# EasyEDA Pro project 2023新生开发板（小组）.eprj, board PCB5
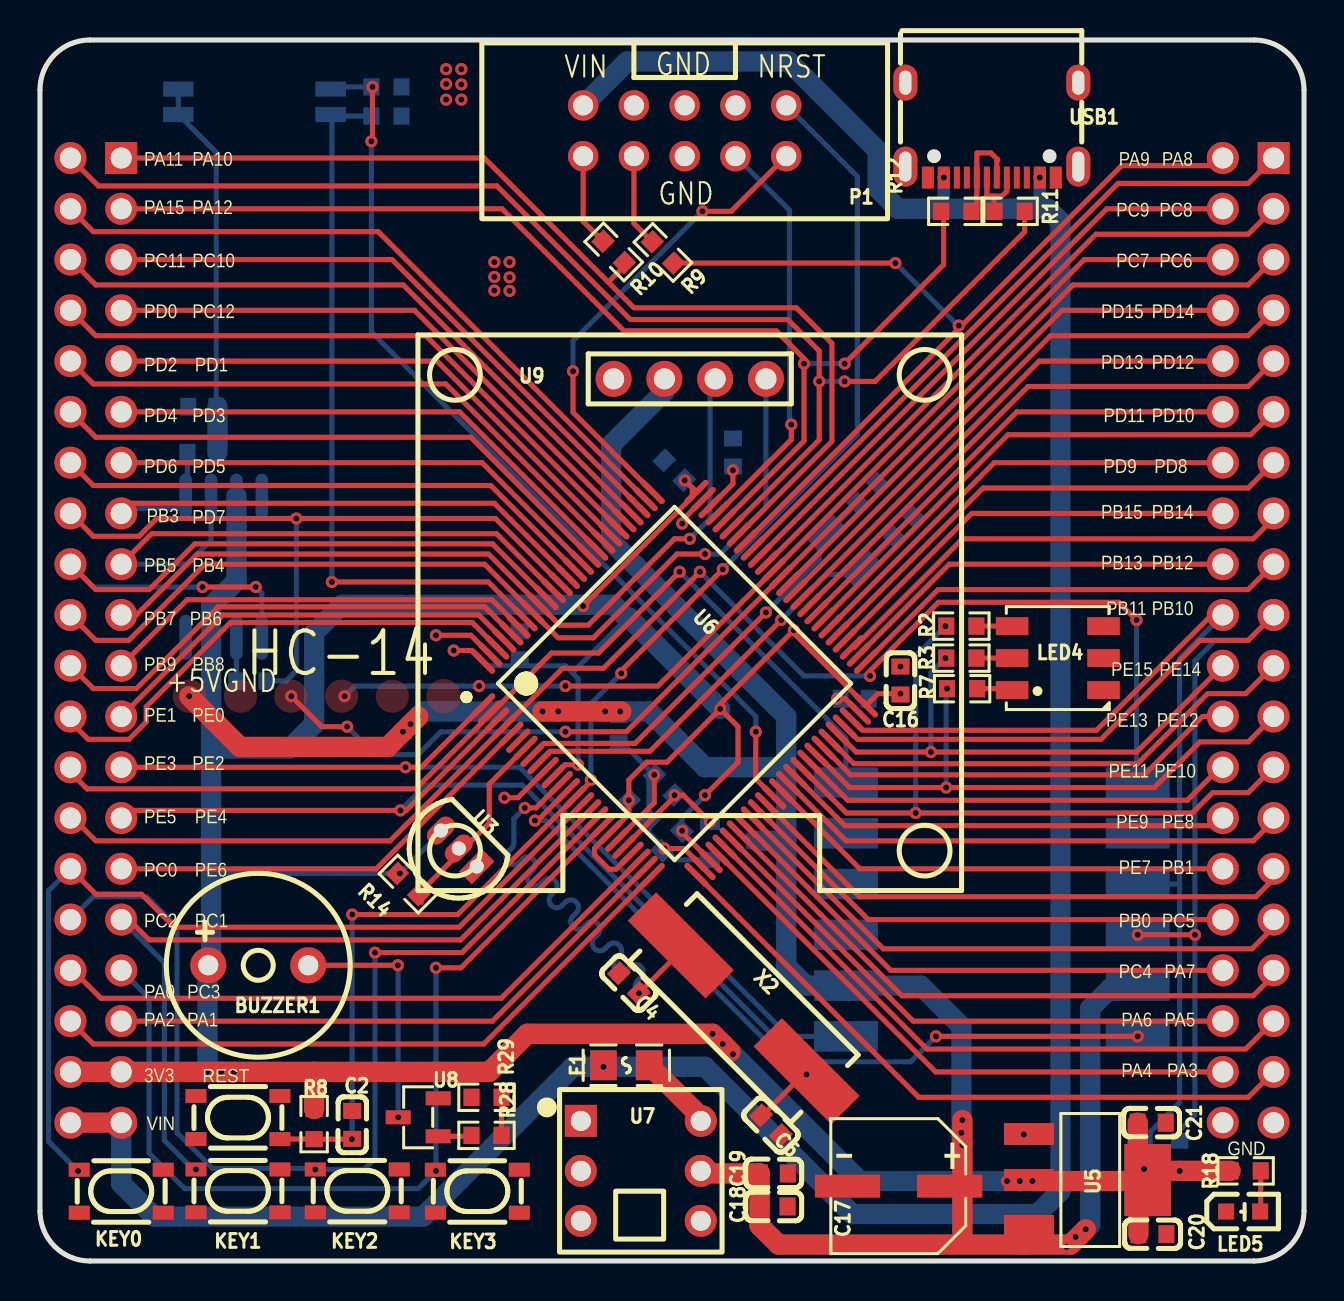
[diagram p6: board, top side]
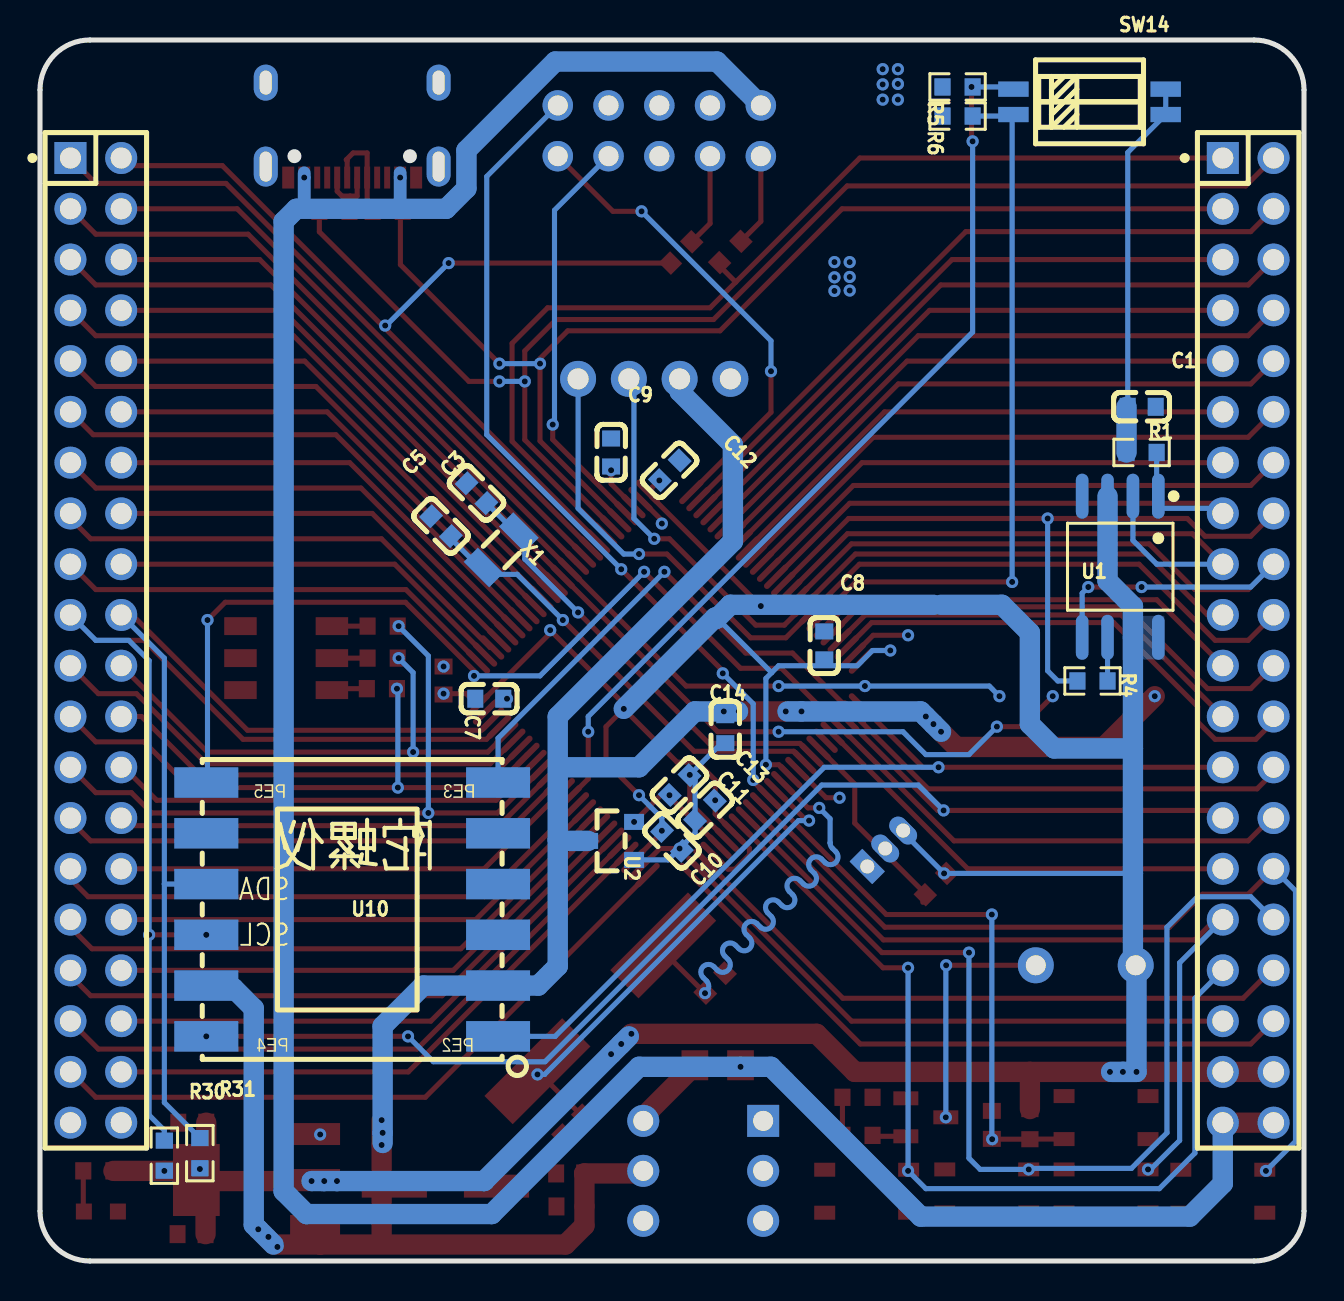
[diagram p7: board, bottom side, seen from below]

Outline 63.25 x 61.09 mm; copper layers: Top Layer, Bottom Layer. Coordinates in mm from the lower left corner of the outline.
Outline path: 0,58.59 0,2.5 arc(0.73,0.73) 2.5,0 60.75,0 arc(62.51,0.73) 63.25,2.5 63.25,58.59 arc(62.51,60.35) 60.75,61.09 2.5,61.09 arc(0.73,60.35) 0,58.59
Stack: Top Layer 0.035mm / Dielectric1 1.51mm FR4 er 4.5 / Bottom Layer 0.035mm

## Design rules (mm)
template: 自定义配置
spacing copperThickness1oz (default): track to track 0.102, other pairs 0.152 to 0.3
spacing copperThickness2oz: track to track 0.203, other pairs 0.152 to 0.3
track width copperThickness1oz (default): min 0.127, default 0.254, max 2.54
track width copperThickness2oz: min 0.203, default 0.254, max 2.54
differential pair differentialPair (default): width min 0.127, default 0.254, max 2.54; gap min 0.152, default 0.152
via viaSize (default): diameter min 0.5, default 0.61, max 10; hole min 0.3, default 0.305, max 6.3
net 3V3 uses copperRegion1
net VIN uses copperRegion1

## Placement (name value [footprint] x y rotation side)
BUZZER1  3kHz  [BUZ-TH_BD9.0-P5.00-D0.6-FD]  10.92 14.8 0 top
C1  100nF  [C0603]  8.12 42.74 180 bottom
C2  100nF  [C0603]  15.62 6.81 270 top
C3  12pF  [C0603]  41.4 38.42 225 bottom
C4  20pF  [C0603]  29.46 13.91 135 top
C5  12pF  [C0603]  43.18 36.77 225 bottom
C6  20pF  [C0603]  36.58 6.79 315 top
C7  1uF  [C0603]  40.77 28.13 180 bottom
C8  100nF  [C0603]  24 30.8 90 bottom
C9  1uF  [C0603]  34.67 40.45 270 bottom
C10  100nF  [C0603]  31.62 21.02 225 bottom
C11  100nF  [C0603]  29.97 22.54 315 bottom
C12  100nF  [C0603]  31.74 39.56 135 bottom
C13  100nF  [C0603]  31.24 23.81 135 bottom
C14  1uF  [C0603]  28.96 26.61 90 bottom
C16  100nF  [C0603]  43.05 29.04 90 top
C17  220uF  [CAP-SMD_BD6.3-L6.6-W6.6-LS7.2-R-RD]  42.96 3.75 0 top
C18  1uF  [C0603]  36.7 2.73 180 top
C19  100nF  [C0603]  36.72 4.38 0 top
C20  1uF  [C0603]  55.66 1.34 180 top
C21  100nF  [C0603]  55.63 6.92 0 top
F1  BSMD0805-020-30V  [F0805]  29.34 9.79 180 top
H1  X6521WV-2x20H-C60D30  [HDR-TH_40P-2.54-V-M-R2-C20-S2.54]  60.45 31.05 270 bottom
H2  X6521WV-2x20H-C60D30  [HDR-TH_40P-2.54-V-M-R2-C20-S2.54]  2.79 31.05 270 bottom
KEY0  SKRPACE010  [KEY-SMD_4P-L4.2-W3.2-P2.20-LS4.6]  4.06 3.49 0 top
KEY1  SKRPACE010  [KEY-SMD_4P-L4.2-W3.2-P2.20-LS4.6]  9.91 3.51 0 top
KEY2  SKRPACE010  [KEY-SMD_4P-L4.2-W3.2-P2.20-LS4.6]  15.88 3.51 0 top
KEY3  SKRPACE010  [KEY-SMD_4P-L4.2-W3.2-P2.20-LS4.6]  21.88 3.49 0 top
LED4  MHP5050RGBDT  [LED-ARRAY-SMD_6P-L5.0-W5.0-TR-RD]  50.93 30.16 180 top
LED5  NCD0603R3  [LED0603-R-RD_RED]  60.2 2.48 0 top
P1  2.54-2*5P简牛  [IDC-TH_10P-P2.54_C5665]  32.26 56.54 180 top
R1  10kΩ  [R0603]  8.13 40.45 180 bottom
R2  220Ω  [R0603]  46.1 31.76 0 top
R3  220Ω  [R0603]  46.1 30.16 0 top
R4  20Ω  [R0603]  10.58 29.02 0 bottom
R5  10kΩ  [R0603]  17.34 58.74 0 bottom
R6  10kΩ  [R0603]  17.34 57.28 0 bottom
R7  220Ω  [R0603]  46.14 28.63 0 top
R8  10kΩ  [R0603]  13.72 6.85 270 top
R9  20Ω  [R0603]  31.17 50.46 315 top
R10  20Ω  [R0603]  28.71 50.48 135 top
R11  20Ω  [R0603]  48.51 52.51 180 top
R12  20Ω  [R0603]  45.85 52.51 0 top
R14  10K  [R0603]  18.42 18.86 135 top
R18  470Ω  [R0603]  60.33 4.51 0 top
R28  4.7K  [R0603]  22.34 6.29 180 top
R29  10K  [R0603]  22.34 8.19 180 top
R30  4.7K  [R0603]  57.02 5.27 270 bottom
R31  4.7K  [R0603]  55.24 5.4 270 bottom
REST  SKRPACE010  [KEY-SMD_4P-L4.2-W3.2-P2.20-LS4.6]  9.91 7.18 180 top
SW14  DSHP02TSGET  [SW-SMD_4P_DSHP02TSGET]  10.73 57.99 270 bottom
U1  W25Q16JVSSIQ  [SOIC-8_L5.3-W5.3-P1.27-LS8.0-BL]  9.2 34.73 0 bottom
U2  PJ75AL33SA  [SOT-23_L2.9-W1.3-P1.90-LS2.4-BR]  34.67 21.02 180 bottom
U3  DS18B20  [TO-92-3_L4.9-W3.7-P1.27-L]  20.95 20.64 135 top
U5  AMS1117-3.3  [SOT-223-3_L6.5-W3.4-P2.30-LS7.0-BR]  52.45 4.05 180 top
U6  STM32F407VET6  [LQFP-100_L14.0-W14.0-P0.50-LS16.0-BL]  31.75 28.89 315 top
U7  PB-22E08  [SW-TH_6P-L8.0-W8.0-P2.50_PB-22E08]  30.06 4.51 270 top
U8  SS8050  [SOT-23-3_L2.9-W1.3-P1.90-LS2.4-BR]  18.92 7.19 0 top
U9  HS96L03W2C03  [OLED-TH_L27.8-W27.2-P2.54_C9900033791]  32.51 44.13 0 top
U10  jy901s  [COMM-SMD_JY901S-1]  47.63 17.59 0 bottom
USB1  TYPE-C 16PIN 2MD(073)  [USB-C-SMD_TYPE-C-6PIN-2MD-073]  47.63 56.58 180 top
X1  32.768kHz  [FC-135R_L3.2-W1.5]  40.17 35.58 135 bottom
X2  8MHz  [CRYSTAL-SMD_L11.5-W4.8-LS12.7]  35.21 12.64 315 top

## Footprints (pads in the part's own frame, mm; a bottom-side part is the same pattern mirrored in y, then rotated)
BUZ-TH_BD9.0-P5.00-D0.6-FD
  round 1.8 hole 1: 1(-2.5,0) 2(2.5,0)
C0603
  rect 0.8x0.9 smd: 1(-0.7,0) 2(0.7,0)
CAP-SMD_BD6.3-L6.6-W6.6-LS7.2-R-RD
  rect 3.26x1.15 smd: 1(2.555,0) 2(-2.555,0)
COMM-SMD_JY901S-1
  rect 3.2x1.524 smd: 1(-7.3,6.35) 2(-7.3,3.81) 3(-7.3,1.27) 4(-7.3,-1.27) 5(-7.3,-3.81) 6(-7.3,-6.35) 7(7.3,-6.35) 8(7.3,-3.81) 9(7.3,-1.27) 10(7.3,1.27) 11(7.3,3.81) 12(7.3,6.35)
CRYSTAL-SMD_L11.5-W4.8-LS12.7
  rect 5.5x2 smd: 1(-4.45,0) 2(4.45,0)
F0805
  rect 1.335x1.5 smd: 1(-1.143,0) 2(1.143,0)
FC-135R_L3.2-W1.5
  rect 1x1.8 smd: 1(-1.25,0) 2(1.25,0)
HDR-TH_40P-2.54-V-M-R2-C20-S2.54
  rect 1.6x1.6 hole 1.05: 1(-24.13,-1.27)
  round 1.6 hole 1.05: 2(-24.13,1.27) 3(-21.59,-1.27) 4(-21.59,1.27) 5(-19.05,-1.27) 6(-19.05,1.27) 7(-16.51,-1.27) 8(-16.51,1.27) 9(-13.97,-1.27) 10(-13.97,1.27) 11(-11.43,-1.27) 12(-11.43,1.27) 13(-8.89,-1.27) 14(-8.89,1.27) 15(-6.35,-1.27) 16(-6.35,1.27) 17(-3.81,-1.27) 18(-3.81,1.27) 19(-1.27,-1.27) 20(-1.27,1.27) 21(1.27,-1.27) 22(1.27,1.27) 23(3.81,-1.27) 24(3.81,1.27) 25(6.35,-1.27) 26(6.35,1.27) 27(8.89,-1.27) 28(8.89,1.27) 29(11.43,-1.27) 30(11.43,1.27) 31(13.97,-1.27) 32(13.97,1.27) 33(16.51,-1.27) 34(16.51,1.27) 35(19.05,-1.27) 36(19.05,1.27) 37(21.59,-1.27) 38(21.59,1.27) 39(24.13,-1.27) 40(24.13,1.27)
IDC-TH_10P-P2.54_C5665
  round 1.524 hole 1: 1(-5.08,-1.27) 2(-5.08,1.27) 3(-2.54,-1.27) 4(-2.54,1.27) 5(0,-1.27) 6(0,1.27) 7(2.54,-1.27) 8(2.54,1.27) 9(5.08,-1.27) 10(5.08,1.27)
KEY-SMD_4P-L4.2-W3.2-P2.20-LS4.6
  rect 1.05x0.7 smd: 1(-2.1,1.075) 2(2.1,1.075) 3(-2.1,-1.075) 4(2.1,-1.075)
LED0603-R-RD_RED
  rect 0.8x0.8 smd: 1(0.851,0) 2(-0.851,0)
LED-ARRAY-SMD_6P-L5.0-W5.0-TR-RD
  rect 1.625x0.896 smd: 1(2.288,1.6) 2(-2.288,1.6) 3(2.288,0) 4(-2.288,0) 5(2.288,-1.6) 6(-2.288,-1.6)
LQFP-100_L14.0-W14.0-P0.50-LS16.0-BL
  oval 0.3x1.6 smd: 1(-6,-7.55) 2(-5.5,-7.55) 3(-5,-7.55) 4(-4.5,-7.55) 5(-4,-7.55) 6(-3.5,-7.55) 7(-3,-7.55) 8(-2.5,-7.55) 9(-2,-7.55) 10(-1.5,-7.55) 11(-1,-7.55) 12(-0.5,-7.55) 13(0,-7.55) 14(0.5,-7.55) 15(1,-7.55) 16(1.5,-7.55) 17(2,-7.55) 18(2.5,-7.55) 19(3,-7.55) 20(3.5,-7.55) 21(4,-7.55) 22(4.5,-7.55) 23(5,-7.55) 24(5.5,-7.55) 25(6,-7.55) 51(6,7.55) 52(5.5,7.55) 53(5,7.55) 54(4.5,7.55) 55(4,7.55) 56(3.5,7.55) 57(3,7.55) 58(2.5,7.55) 59(2,7.55) 60(1.5,7.55) 61(1,7.55) 62(0.5,7.55) 63(0,7.55) 64(-0.5,7.55) 65(-1,7.55) 66(-1.5,7.55) 67(-2,7.55) 68(-2.5,7.55) 69(-3,7.55) 70(-3.5,7.55) 71(-4,7.55) 72(-4.5,7.55) 73(-5,7.55) 74(-5.5,7.55) 75(-6,7.55)
  oval 1.6x0.3 smd: 26(7.55,-6) 27(7.55,-5.5) 28(7.55,-5) 29(7.55,-4.5) 30(7.55,-4) 31(7.55,-3.5) 32(7.55,-3) 33(7.55,-2.5) 34(7.55,-2) 35(7.55,-1.5) 36(7.55,-1) 37(7.55,-0.5) 38(7.55,0) 39(7.55,0.5) 40(7.55,1) 41(7.55,1.5) 42(7.55,2) 43(7.55,2.5) 44(7.55,3) 45(7.55,3.5) 46(7.55,4) 47(7.55,4.5) 48(7.55,5) 49(7.55,5.5) 50(7.55,6) 76(-7.55,6) 77(-7.55,5.5) 78(-7.55,5) 79(-7.55,4.5) 80(-7.55,4) 81(-7.55,3.5) 82(-7.55,3) 83(-7.55,2.5) 84(-7.55,2) 85(-7.55,1.5) 86(-7.55,1) 87(-7.55,0.5) 88(-7.55,0) 89(-7.55,-0.5) 90(-7.55,-1) 91(-7.55,-1.5) 92(-7.55,-2) 93(-7.55,-2.5) 94(-7.55,-3) 95(-7.55,-3.5) 96(-7.55,-4) 97(-7.55,-4.5) 98(-7.55,-5) 99(-7.55,-5.5) 100(-7.55,-6)
OLED-TH_L27.8-W27.2-P2.54_C9900033791
  round 1.8 hole 1.05: 1(-3.81,0) 2(-1.27,0) 3(1.27,0) 4(3.81,0)
R0603
  rect 0.806x0.864 smd: 1(-0.753,0) 2(0.753,0)
SOIC-8_L5.3-W5.3-P1.27-LS8.0-BL
  oval 0.63x2.25 smd: 1(-1.905,-3.53) 2(-0.635,-3.53) 3(0.635,-3.53) 4(1.905,-3.53) 5(1.905,3.53) 6(0.635,3.53) 7(-0.635,3.53) 8(-1.905,3.53)
SOT-23-3_L2.9-W1.3-P1.90-LS2.4-BR
  rect 1.25x0.7 smd: 1(1,-0.95) 2(1,0.95) 3(-1,0)
SOT-23_L2.9-W1.3-P1.90-LS2.4-BR
  rect 1x0.8 smd: 1(1.15,-0.95) 2(1.15,0.95) 3(-1.15,0)
SOT-223-3_L6.5-W3.4-P2.30-LS7.0-BR
  rect 2.5x1.1 smd: 1(2.97,-2.3) 2(2.97,0) 3(2.97,2.3)
  rect 2.34x3.6 smd: 4(-2.97,0)
SW-SMD_4P_DSHP02TSGET
  rect 0.762x1.524 smd: 1(-0.635,-3.81) 2(0.635,-3.81) 3(0.635,3.81) 4(-0.635,3.81)
SW-TH_6P-L8.0-W8.0-P2.50_PB-22E08
  rect 1.6x1.6 hole 1: 1(-2.5,-3)
  round 1.6 hole 1: 2(0,-3) 3(2.5,-3) 4(-2.5,3) 5(0,3) 6(2.5,3)
TO-92-3_L4.9-W3.7-P1.27-L
  rect 0.9x1.6 hole 0.7: 1(-1.27,0)
  oval 0.9x1.6 hole 0.7: 2(0,0) 3(1.27,0)
USB-C-SMD_TYPE-C-6PIN-2MD-073
  rect 0.6x1.1 smd: 1(-3.2,2.375) 2(-2.4,2.375) 11(2.4,2.375) 12(3.2,2.375)
  rect 0.3x1.1 smd: 3(-1.75,2.375) 4(-1.25,2.375) 5(-0.75,2.375) 6(-0.25,2.375) 7(0.25,2.375) 8(0.75,2.375) 9(1.25,2.375) 10(1.75,2.375)
  oval 1.2x2 hole 0.6x1.5: 13(-4.325,1.825) 14(4.325,1.825)
  oval 1.2x1.8 hole 0.6x1.2: 13(-4.325,-2.375) 14(4.325,-2.375)

## Nets
As in the schematic, except:
GND: C1.2 C2.1 C3.1 C4.2 C5.1 C6.2 C7.1 C8.2 C9.1 C10.2 C11.2 C12.2 C13.2 C14.1 C16.2 C17.2 C18.1 C19.2 C20.1 C21.2 H1.39 H1.40 KEY0.4 KEY1.4 KEY2.4 KEY3.4 LED4.2 LED4.4 LED4.6 LED5.2 P1.5 P1.6 R5.2 R6.2 R29.2 REST.4 U1.4 U2.1 U3.1 U5.1 U6.10 U6.20 U6.27 U6.74 U6.99 U8.2 U9.1 U10.5 U10.8 USB1.1 USB1.12 USB1.13 USB1.14
KEY0: H2.30 KEY0.1 U6.15
KEY1: H2.31 KEY1.1 U6.16
KEY2: H2.32 KEY2.1 U6.17
KEY3: H2.33 KEY3.1 U6.18
NRST: C2.2 P1.1 R8.2 REST.1 U6.14

Pads without a net: KEY0 2 3; KEY1 2 3; KEY2 2 3; KEY3 2 3; P1 3 7; REST 2 3; U7 1 2 3 6; U10 3 4; USB1 3 4 9 10

## Via types
v1: diameter 0.61, hole 0.305, Top Layer to Bottom Layer, 121 vias

## Routing (per net, layer and track width the routed paths; a pad name or vN(x,y) marks a point on that pad's centre or on a via; arc(x,y) is an arc through that point)
3V3: length 228.2
  Top Layer w0.254: U6.11 26.27,24.83 v1(26.92,24.83) ; 32.64,38.68 32.27,39.05 v1(32.26,39.05) ; 32.64,38.68 U6.75 ; 32.64,38.68 32.64,38.23 v1(27.18,32.77) ; 33.55,20.02 32.13,21.44 v1(32.13,21.53) ; 22.17,29.99 21.61,30.54 v1(20.7,30.54) ; U6.22 28.83,19.6 28.47,19.6 27.75,20.32 27.75,20.65 29.46,22.36 v1(29.46,23.05) 29.46,24.07 30.35,24.96 31.37,24.96 v1(34.04,27.62) ; v1(33.27,23.3) 34.92,24.96 34.92,26.73 v1(34.04,27.62) ; v1(34.04,27.62) 34.04,27.88 v1(37.72,31.56) 37.72,31.41 U6.50 41.92,28.38 v1(43.05,28.38)
  Top Layer w1.016: 13.72,9.46 22.48,9.46 24.38,11.37 v1(33.65,11.37) v1(34.16,10.86) 34.54,10.48 ; 13.72,9.46 v1(9.71,9.46) v1(9.06,9.46) v1(8.38,9.46) H2.37 H2.38 ; 13.72,9.46 13.72,7.6 ; v1(49.02,4) 49.15,4 ; C20.2 54.96,3.83 55.64,4.51 v1(57.02,4.51) 59.57,4.51 ; C21.1 54.93,4.03 ; v1(49.66,4) 54.86,4
  Bottom Layer w0.254: v1(33.27,23.3) 32.13,22.16 v1(32.13,21.53) ; v1(20.7,30.54) 21.59,30.54 22.35,29.78 26.29,29.78 26.64,29.43 ; C1.1 8.82,55.46 SW14.3 SW14.4 ; U3.3 20.06,21.44 v1(18.01,19.39) 8.44,19.39 8.42,19.41 ; 26.64,29.43 29.33,32.13 29.4,32.13 ; 26.64,29.43 26.92,29.15 v1(26.92,24.83)
  Bottom Layer w1.016: 33.78,11.24 v1(34.16,10.86) v1(34.67,10.35) 41.02,4 v1(48.39,4) v1(49.02,4) v1(49.66,4) ; 8.56,25.64 8.56,14.93 BUZZER1.1 8.38,14.76 v1(8.38,9.46) v1(9.06,9.46) 9.65,9.46 ; 8.56,25.64 12.5,25.64 13.72,26.86 13.72,31.43 15.11,32.83 18.16,32.83 ; 8.56,25.64 U1.7 8.56,32.75 9.83,34.02 U1.3 ; v1(34.04,27.62) 29.47,32.19 29.4,32.13 28.7,32.83 18.54,32.83 ; 8.88,42.73 R1.1
  vias: v1(55.24,4.6)
+5V: length 130.1
  Top Layer w1.016: v1(7.47,28.26) 10.01,25.72 17.4,25.72 v1(18.16,26.48) v1(18.54,26.86) v1(18.92,27.24) ; v1(52.32,1.59) 51.56,0.83 49.22,0.83 ; 29.08,27.5 v1(28.28,27.5) v1(25.93,27.5) v1(25.14,27.5) ; 49.22,0.83 49.23,0.83 49.23,1.73 ; 49.22,0.83 36.95,0.83 36,1.77 C18.2 36,4.37 C19.1 33.19,4.38 U7.5 ; v1(46.15,7.05) v1(46.15,5.81) 46.15,1.34
  Bottom Layer w1.016: 28.32,27.5 v1(29.03,27.5) 30.48,27.5 33.27,24.7 37.08,24.7 ; 37.34,21.07 37.34,27.24 28.58,36 28.58,40.83 31.24,43.5 31.24,43.88 ; 37.34,21.07 37.28,21.02 U2.3 ; 37.34,21.07 37.34,14.76 38.31,13.78 39.62,13.78 39.75,13.65 ; 54.92,13.65 53.56,13.65 52.55,12.64 52.55,1.81 v1(52.32,1.59) 51.56,0.83 ; 25.84,27.5 v1(25.14,27.5) 19.18,27.5 v1(18.92,27.24) v1(18.54,26.86) v1(18.16,26.48) ; 46.1,5.91 v1(46.1,6.41) 46.1,11.75 44.07,13.78 U10.2
  vias: v1(51.37,0.7) v1(51.82,1.21)
GND: length 22.9
  Top Layer w0.254: U6.99 21.56,31.31 v1(19.81,31.31) ; 33.2,19.66 32.23,20.64 v1(31.24,20.64) ; U6.20 30.73,22.93 v1(30.73,24.32) ; v1(23.24,23.18) 23.91,23.18 U6.10 ; v1(32.13,36.89) 32.13,37.05 U6.74
  Bottom Layer w0.254: U2.1 31.81,20.07 v1(31.24,20.64) 30.47,21.41 C11.2 30.47,24.03 C13.2 ; C14.1 29.15,25.91 v1(30.73,24.32)
  vias: v1(20.32,59.63) v1(20.32,58.89) v1(20.32,58.1) v1(21.08,59.63) v1(21.08,58.86) v1(21.08,58.1) v1(22.73,49.97) v1(22.73,49.23) v1(22.73,48.55) v1(23.49,49.97) v1(23.49,49.21) v1(23.49,48.53) v1(43.05,29.74) v1(49.23,6.33)
VIN: length 141.1
  Top Layer w1.016: H2.40 H2.39
  Bottom Layer w0.635: 45.18,52.64 45.23,52.69 v1(45.23,54.2) 45.23,54.44 ; 50.02,54.44 v1(50.02,54.2) 50.02,52.76
  Bottom Layer w1.016: H2.39 4.06,3.87 5.72,2.22 19.18,2.22 26.67,9.72 v1(28.19,9.72) 33.27,9.72 40.64,2.35 49.91,2.35 51.05,3.49 51.05,52.01 50.42,52.64 42.93,52.64 41.91,53.66 41.91,55.56 37.46,60.01 29.37,60.01 27.18,57.81
BOOT0: length 35.9
  Top Layer w0.254: v1(14.61,33.97) 22.43,33.97 U6.94
  Bottom Layer w0.254: 14.61,57.29 v1(14.61,33.97) ; 14.61,57.29 14.62,57.28 R6.1 ; 14.61,57.29 SW14.2
BOOT1: length 46
  Top Layer w0.254: U6.37 35.81,24.12 v1(35.81,26.48) ; v1(16.58,56.02) 16.64,56.07 v1(16.64,58.74)
  Bottom Layer w0.254: v1(16.58,56.02) 16.58,46.47 35.81,27.24 v1(35.81,26.48) ; v1(16.64,58.74) 14.65,58.74 SW14.1
BUZZER: length 1.9
  Top Layer w0.254: R28.1 R29.1
DS18B20: length 9.9
  Top Layer w0.254: 19.07,17.95 19.07,18.5 22.48,21.91 22.48,23.86 U6.7
FLASH_CS: length 30.3
  Top Layer w0.254: H2.15 4.57,37.91 22.73,37.91 U6.88
  Bottom Layer w0.254: 7.44,38.29 7.44,37.86 7.24,37.66 4.32,37.66 H2.15 ; R1.2 7.37,38.35 U1.1
KEY0: length 45.5
  Top Layer w0.254: H2.30 2.79,18.35 5.08,18.35 6.73,16.7 20.97,16.7 U6.15
  Bottom Layer w0.254: 1.78,4.51 1.84,4.57 0.43,5.99 0.43,18.52 H2.30
  vias: v1(1.91,4.51)
KEY1: length 40.6
  Top Layer w0.254: H2.31 4.45,17.08 5.46,16.07 21.04,16.07 27.47,22.49
  Bottom Layer w0.254: 7.75,4.51 6.22,6.03 6.22,14.92 H2.31
  vias: v1(7.81,4.58)
KEY2: length 51.8
  Top Layer w0.254: U6.17 21.12,15.43 v1(16.76,15.43)
  Bottom Layer w0.254: v1(16.76,15.43) 16.76,5.14 16.2,4.58 v1(13.77,4.58) ; H2.32 2.67,18.22 5.33,18.22 6.86,16.7 6.86,6.41 8.64,4.64 13.84,4.64
KEY3: length 46.7
  Top Layer w0.254: v1(19.81,14.67) 21.06,14.67 U6.18
  Bottom Layer w0.254: v1(19.81,14.67) v1(19.81,4.51) 18.92,3.62 7.24,3.62 5.46,5.4 5.46,13.14 H2.33
NRST: length 70.4
  Top Layer w0.254: C2.2 v1(15.6,6.09) R8.2 13.71,6.1 REST.1 ; v1(15.62,17.34) 20.9,17.34 U6.14 27.56,23.99 v1(27.56,24.07) ; v1(29.08,29.4) 29.08,29.53 v1(34.16,34.61)
  Bottom Layer w0.254: P1.1 40.89,54.26 40.89,41.34 v1(34.16,34.61) ; v1(27.56,24.07) 27.56,27.88 v1(29.08,29.4) ; v1(15.6,6.09) C2.2 v1(15.62,17.34)
PA0: length 31.7
  Top Layer w0.254: 1.65,14.54 3.05,13.14 23.07,13.14 29.95,20.02
PA1: length 29.4
  Top Layer w0.254: 30.3,19.66 22.64,12 H2.35
PA2: length 33.1
  Top Layer w0.254: 30.65,19.31 22.2,10.86 2.67,10.86 H2.36
PA3: length 34
  Top Layer w0.254: U6.26 43.97,8.19 60.45,8.19 H1.37
PA4: length 29.8
  Top Layer w0.254: H1.38 44.82,9.46 U6.29
PA5: length 32.2
  Top Layer w0.254: 34.26,20.73 44.38,10.6 60.33,10.6 H1.35
PA6: length 28.3
  Top Layer w0.254: H1.36 43.69,12 U6.31
PA7: length 30.8
  Top Layer w0.254: 34.97,21.43 43.13,13.27 60.71,13.27 61.72,14.29 H1.33
PA8: length 34.1
  Top Layer w0.254: U6.67 53.94,53.91 60.45,53.91 H1.1
PA9: length 47.5
  Top Layer w0.254: 46.13,46.81 54.12,54.8 58.8,54.8 H1.2 ; 46.13,46.81 U6.68 ; 46.13,46.81 45.98,46.81 v1(45.97,46.8) ; R9.2 v1(42.8,49.93)
  Bottom Layer w0.254: v1(42.8,49.93) 45.92,46.8 v1(45.97,46.8)
PA10: length 52.2
  Top Layer w0.254: R10.1 29.24,49.78 28.43,48.97 ; 28.43,48.97 29.72,47.69 37.85,47.69 39.62,45.91 39.62,41.01 U6.69 ; 28.43,48.97 22.23,55.18 H2.1
PA11: length 66.4
  Top Layer w0.254: H2.2 2.92,53.78 22.86,53.78 29.54,47.1 37.42,47.1 38.99,45.53 v1(38.99,44.01) 38.99,41.08 U6.70 ; 49.27,52.38 49.27,51.49 41.78,44.01 v1(40.26,44.01)
  Bottom Layer w0.254: v1(40.26,44.01) v1(38.99,44.01)
PA12: length 58.7
  Top Layer w0.254: 45.22,52.51 45.21,52.51 45.21,49.85 v1(40.26,44.89) ; 34.26,37.06 38.23,41.03 v1(38.23,44.89) 38.23,45.15 36.84,46.54 29.22,46.54 23.11,52.64 H2.3
  Bottom Layer w0.254: v1(40.26,44.89) v1(38.23,44.89)
PA13: length 20.5
  Top Layer w0.254: U6.72 37.59,41.1 v1(37.59,41.85)
  Bottom Layer w0.254: v1(37.59,41.85) 37.5,41.94 37.5,52.57 P1.4
PA14: length 23.7
  Top Layer w0.254: P1.2 34.58,52.51 v1(33.15,52.51) ; 30.65,38.47 26.67,42.46 v1(26.67,44.51)
  Bottom Layer w0.254: v1(33.15,52.51) 26.67,46.04 v1(26.67,44.51)
PA15: length 34.8
  Top Layer w0.254: U6.77 16.92,51.5 2.67,51.5 H2.4
PB0: length 25.4
  Top Layer w0.254: H1.32 41.44,17.08 U6.35
PB1: length 28.1
  Top Layer w0.254: U6.36 41,18.22 60.83,18.22 61.72,19.11 H1.29
PB3: length 36.1
  Top Layer w0.254: H2.16 2.67,36.26 4.95,36.26 5.84,37.15 v1(12.83,37.15) 22.79,37.15 26.06,33.88
  Bottom Layer w0.254: R4.2 12.32,29.02 12.83,29.53 v1(12.83,37.15)
PB4: length 31.2
  Top Layer w0.254: U6.90 22.84,36.39 5.59,36.39 H2.17
  Bottom Layer w0.254: 8.56,38.77 8.56,36.06 7.37,34.86 H2.17
PB5: length 38.8
  Top Layer w0.254: v1(8.13,33.72) v1(10.8,33.72) ; H2.18 2.79,33.59 5.46,33.59 7.75,35.88 22.64,35.88 25.35,33.17
  Bottom Layer w0.254: v1(10.8,33.72) 11.1,33.41 U1.5 ; H2.18 2.67,33.72 v1(8.13,33.72)
PB6: length 41.6
  Top Layer w0.254: H2.19 4.83,32.32 7.87,35.37 22.44,35.37 U6.92 26,31.81 27.43,31.81 31.75,36.13 v1(32.51,36.13)
  Bottom Layer w0.254: v1(32.51,36.13) 33.53,37.15 33.53,43.75 33.91,44.13
PB7: length 47.3
  Top Layer w0.254: v1(33.27,35.37) 31.88,35.37 27.69,31.18 25.93,31.18 U6.93 22.25,34.86 8.25,34.86 4.45,31.05 2.79,31.05 H2.20
  Bottom Layer w0.254: v1(33.27,35.37) 34.04,35.37 36.32,37.66 36.32,43.5 36.07,43.75
PB8: length 21.8
  Top Layer w0.254: U6.95 22.61,33.08 7.37,33.08 H2.21
PB9: length 24.8
  Top Layer w0.254: U6.96 22.26,32.73 8.92,32.73 4.83,28.64 2.67,28.64 H2.22
PB10: length 56.4
  Top Layer w0.254: U6.47 40.91,26.1 53.09,26.1 58.04,31.05 60.45,31.05 H1.19 ; v1(57.79,16.32) v1(54.92,16.32)
  Bottom Layer w0.254: R30.1 57.02,6.54 57.79,7.3 v1(57.79,16.32) 57.79,30.04 58.8,31.05 60.45,31.05 H1.19
PB11: length 51.1
  Top Layer w0.254: H1.20 58.63,32.32 52.86,26.55 41.16,26.55 40.62,27.09
  Bottom Layer w0.254: R31.1 57.02,7.93 57.02,18.86 ; U10.9 57.02,18.86 ; 57.02,18.86 57.02,30.16 H1.20
PB12: length 22.4
  Top Layer w0.254: H1.17 60.45,33.59 44.93,33.59 41.33,29.99
PB13: length 20.1
  Top Layer w0.254: H1.18 45.5,34.86 40.98,30.34
PB14: length 24
  Top Layer w0.254: 40.62,30.7 40.72,30.7 46.16,36.13 60.71,36.13 61.72,37.15 H1.15
PB15: length 21.5
  Top Layer w0.254: U6.54 46.62,37.4 H1.16
PC4: length 26.9
  Top Layer w0.254: H1.34 42.57,14.54 U6.33
PC5: length 29.6
  Top Layer w0.254: H1.31 61.72,16.7 60.64,15.62 42.19,15.62 U6.34
PC6: length 60.6
  Top Layer w0.254: v1(26.29,26.48) 29.34,26.48 U6.63 51.69,48.83 60.45,48.83 H1.5 ; v1(12.57,28.26) 14.1,26.73 v1(15.37,26.73)
  Bottom Layer w0.254: v1(15.37,26.73) 16.76,25.34 18.92,25.34 20.07,26.48 v1(26.29,26.48)
PC7: length 53
  Top Layer w0.254: H1.6 52.25,50.1 30.92,28.77 v1(26.29,28.77)
  Bottom Layer w0.254: v1(26.29,28.77) v1(21.97,28.77) 15.75,28.77 v1(15.24,28.26)
PC8: length 32.7
  Top Layer w0.254: U6.65 36.4,34.94 52.83,51.37 60.45,51.37 H1.3
PC9: length 30.3
  Top Layer w0.254: U6.66 53.38,52.64 H1.4
PC10: length 31
  Top Layer w0.254: H2.5 17.61,50.1 U6.78
PC11: length 33.3
  Top Layer w0.254: U6.79 18.17,48.83 2.79,48.83 H2.6
PC12: length 29.5
  Top Layer w0.254: U6.80 18.74,47.56 H2.7
PD0: length 31.9
  Top Layer w0.254: U6.81 28.89,36.71 19.3,46.29 2.79,46.29 H2.8
PD1: length 28.1
  Top Layer w0.254: H2.9 19.86,45.02 U6.82
PD2: length 30.4
  Top Layer w0.254: H2.10 2.67,43.88 20.3,43.88 U6.83
PD3: length 26.6
  Top Layer w0.254: H2.11 20.99,42.48 U6.84
PD4: length 28.9
  Top Layer w0.254: 27.47,35.29 21.55,41.21 2.79,41.21 H2.12
PD5: length 25.1
  Top Layer w0.254: H2.13 22.11,39.94 U6.86
PD6: length 27.5
  Top Layer w0.254: 26.77,34.58 22.55,38.8 2.67,38.8 H2.14
PD8: length 25.3
  Top Layer w0.254: H1.13 60.45,38.67 47.19,38.67 U6.55
PD9: length 23
  Top Layer w0.254: U6.56 47.75,39.94 H1.14
PD10: length 26.8
  Top Layer w0.254: 39.21,32.11 48.44,41.34 60.58,41.34 H1.11
PD11: length 24.5
  Top Layer w0.254: H1.12 48.87,42.48 U6.58
PD12: length 28.3
  Top Layer w0.254: U6.59 49.44,43.75 60.45,43.75 H1.9
PD13: length 25.9
  Top Layer w0.254: H1.10 50,45.02 38.15,33.17
PD14: length 29.7
  Top Layer w0.254: U6.61 50.56,46.29 60.45,46.29 H1.7
PD15: length 27.4
  Top Layer w0.254: U6.62 51.13,47.56 H1.8
PE0: length 21.8
  Top Layer w0.254: U6.97 21.96,32.32 9.14,32.32 H2.23
PE1: length 25.4
  Top Layer w0.254: U6.98 21.63,31.94 9.53,31.94 5.32,27.73 5.32,26.97 4.45,26.1 2.41,26.1 1.52,26.99 H2.24
PE2: length 47
  Top Layer w0.254: H2.25 v1(18.29,24.7) 19.07,24.7 U6.1
  Bottom Layer w0.254: v1(18.29,24.7) 24,24.7 37.46,11.24 U10.1
PE3: length 49.6
  Top Layer w0.254: H2.26 1.52,24.45 2.35,23.62 18.8,23.62 25.6,30.42 27.94,30.42 v1(32,34.48)
  Bottom Layer w0.254: U10.6 40.33,26.16 v1(32,34.48)
PE4: length 64.3
  Top Layer w0.254: U6.3 18.33,22.54 v1(18.03,22.54) 4.45,22.54 H2.27 ; v1(44.83,11.24) 54.74,11.24
  Bottom Layer w0.254: v1(18.03,22.54) 19.3,23.81 24.13,23.81 37.97,9.97 43.56,9.97 v1(44.83,11.24)
  vias: v1(54.92,11.24)
PE5: length 71.7
  Top Layer w0.254: v1(33.02,34.48) 28.19,29.65 26.15,29.65 U6.4 17.51,21.02 2.79,21.02 1.65,22.16 H2.28 ; v1(54.86,32.07) 53.98,32.96 44.96,32.96 41.53,29.53 v1(41.53,29.27)
  Bottom Layer w0.254: v1(54.86,32.07) 54.86,24 U10.7 ; v1(41.53,29.27) 38.23,29.27 v1(33.02,34.48)
PE6: length 22.3
  Top Layer w0.254: H2.29 16.82,19.62 23.58,26.38
PE7: length 23.7
  Top Layer w0.254: U6.38 41.02,19.62 H1.30
PE8: length 26
  Top Layer w0.254: H1.27 61.72,22.03 60.71,21.02 40.33,21.02 U6.39
PE9: length 22.6
  Top Layer w0.254: H1.28 58.8,21.78 40.28,21.78 U6.40
PE10: length 35.4
  Top Layer w0.254: U6.41 40.35,22.42 v1(43.82,22.42) 57.66,22.42 58.67,23.43 60.45,23.43 H1.25
  Bottom Layer w0.254: v1(45.3,31.76) 43.82,30.28 v1(43.82,22.42)
PE11: length 22.2
  Top Layer w0.254: U6.42 40.42,23.05 57.4,23.05 59.05,24.7 H1.26
PE12: length 30
  Top Layer w0.254: H1.23 60.45,25.97 58.04,25.97 55.75,23.69 v1(45.34,23.69) 40.51,23.69 38.88,25.32 U6.43
  Bottom Layer w0.254: v1(45.34,23.69) 45.34,28.64
  vias: v1(45.39,28.63)
PE13: length 21.7
  Top Layer w0.254: 39.21,25.68 40.56,24.32 55.24,24.32 58.17,27.24 H1.24
PE14: length 24.7
  Top Layer w0.254: U6.45 39.57,26.03 40.72,24.88 54.91,24.88 58.42,28.38 60.33,28.38 H1.21
PE15: length 26.4
  Top Layer w0.254: 39.92,26.38 40.84,25.46 v1(44.58,25.46) 54.86,25.46 H1.22
  Bottom Layer w0.254: v1(45.3,30.16) 44.58,29.44 v1(44.58,25.46)
$1N1693: length 24.6
  Top Layer w0.254: U6.13 24.89,22.03 v1(24.77,22.03) ; 38.36,9.5 36.07,7.21 35.83,7.21
  Bottom Layer w0.254: v1(24.77,22.03) 25.3,22.03 37.99,9.33 v1(38.35,9.33)
$1N1695: length 26.1
  Top Layer w0.254: v1(29.97,13.4) 32.06,15.49 X2.1 ; v1(24.26,22.67) 24.82,22.67 26.06,23.91
  Bottom Layer w0.254: v1(24.26,22.67) 23.71,22.12 23.71,20.93 arc(23.71,20.92) 23.71,20.91 arc(23.68,20.77) 23.6,20.65 23.43,20.48 arc(23.43,19.94) 23.97,19.94 24.14,20.11 arc(24.68,20.11) 24.68,19.57 24.51,19.4 arc(24.51,18.86) 25.05,18.86 25.22,19.03 arc(25.76,19.03) 25.76,18.5 25.58,18.32 arc(25.58,17.79) 26.12,17.79 26.3,17.96 arc(26.83,17.96) 26.83,17.42 26.66,17.25 arc(26.66,16.71) 27.2,16.71 27.37,16.88 arc(27.91,16.88) 27.91,16.34 27.74,16.17 arc(27.74,15.63) 28.28,15.63 28.45,15.8 arc(28.99,15.8) 28.99,15.26 28.82,15.09 arc(28.82,14.55) 29.36,14.55 29.53,14.72 arc(30.07,14.72) 30.07,14.19 29.9,14.01 arc(29.78,13.74) 29.9,13.48 v1(29.97,13.4)
$1N1697: length 22.4
  Top Layer w0.254: U6.9 25.53,25.5 30.52,25.5 v1(37.08,32.07)
  Bottom Layer w0.254: C5.2 42.68,36.14 41.23,34.69 X1.1 40.71,34.35 39.37,34.35 v1(37.08,32.07)
$1N1698: length 22.1
  Top Layer w0.254: v1(36.32,32.45) 29.77,25.9 25.22,25.9 U6.8
  Bottom Layer w0.254: C3.2 39.45,36.46 X1.2 38.99,36.17 38.99,35.12 v1(36.32,32.45)
$1N1844: length 6
  Top Layer w0.254: v1(33.52,21.97) 32.18,23.3 31.82,23.3 ; U6.21 31.82,23.3 ; 31.82,23.3 v1(31.75,23.3)
$1N1845: length 1.4
  Top Layer w0.254: 40.98,27.44 40.29,28.13 v1(39.88,28.13)
$1N1846: length 2.3
  Top Layer w0.254: v1(34.67,39.56) 34.67,38.88 U6.73
$1N3154: length 3.5
  Top Layer w0.254: USB1.7 47.38,53.28 47.73,53.28 ; USB1.5 48.38,53.52 48.13,53.28 47.73,53.28 ; 47.73,53.28 47.73,52.55 R11.2
$1N3155: length 5.1
  Top Layer w0.254: 46.73,52.51 46.88,52.66 USB1.8 46.88,55.44 47.58,55.44 47.92,55.09 47.88,55.05 USB1.6
$1N3177: length 2.2
  Bottom Layer w0.254: R4.1 U1.6
$1N3189: length 4.7
  Top Layer w0.254: R9.1 29.72,51.91 P1.8
$1N3192: length 2
  Top Layer w0.254: LED5.1 61.08,2.51 61.08,4.51
$1N3201: length 4.7
  Top Layer w0.254: R10.2 27.18,52.01 27.18,55.27
$1N5487: length 1.8
  Top Layer w0.254: R3.2 LED4.3
$1N5507: length 1.8
  Top Layer w0.254: R7.2 48.57,28.63 LED4.1
$1N5508: length 1.8
  Top Layer w0.254: R2.2 LED4.5
$1N24080: length 12.1
  Top Layer w0.254: BUZZER1.2 v1(17.91,14.8)
  Bottom Layer w0.254: v1(17.91,14.8) 17.92,14.78 v1(17.92,7.19)
$1N24105: length 1.7
  Top Layer w0.254: U8.1 21.54,6.24 R28.2
$1N28924: length 3.9
  Top Layer w1.016: U7.4 33.06,7.21 F1.1

## Copper pours and planes (outline as drawn; the poured copper is in the pictures)
3V3 on Bottom Layer: 6.98,32.28 9.07,32.28 9.07,30.09 6.98,30.09
3V3 on Bottom Layer: 9.78,40.87 8.47,40.87 8.38,40.83 8.38,39.9 8.47,39.81 9.43,39.81 9.43,37.15 9.56,37.02 10.08,37.02 10.21,37.15 10.22,40.45
3V3 on Bottom Layer: 6.98,32.19 9.07,32.19 9.07,30.09 6.98,30.09
+5V on Top Layer: 6.64,29.09 8.3,29.09 8.3,27.43 6.64,27.43
GND on Top Layer: -3.3,62.93 64.77,62.93 64.77,-5.4 -3.3,-5.4
GND on Top Layer: 9.2,29.09 10.86,29.09 10.86,27.43 9.2,27.43
GND on Bottom Layer: -6.73,68.52 69.09,68.52 69.09,-3.75 -6.73,-3.75
(no net) on Top Layer: 19.33,29.12 21.05,29.12 21.05,27.4 19.33,27.4
(no net) on Top Layer: 16.8,29.09 18.46,29.09 18.46,27.43 16.8,27.43
PC6 on Top Layer: 11.72,29.09 13.38,29.09 13.38,27.43 11.72,27.43
PC7 on Top Layer: 14.26,29.09 15.92,29.09 15.92,27.43 14.26,27.43

## Text on the board
Bottom Silkscreen Layer: SDA | SCL | PE3 | PE2 | PE4 | PE5 | 陀螺仪
Top Silkscreen Layer: +5V | GND | VIN | NRST | HC-14 | PA11 | PA15 | PC11 | PD0 | PD2 | PD4 | PD6 | PB5 | PB7 | PB9 | PE1 | PE3 | PE5 | PC0 | PC2 | PA0 | PA2 | 3V3 | PB3 | PC3 | PA1 | PB6 | PA10 | PA12 | PC10 | PC12 | PD3 | PD5 | PD7 | PB4 | PB8 | PE0 | PE2 | PD1 | PE4 | PE6 | PC1 | PD15 | PD13 | PB15 | PB13 | PD11 | PD9 | PB11 | PE13 | PE11 | PE15 | PC9 | PC7 | PE9 | PA9 | PE7 | PB0 | PC4 | PA6 | PA4 | PD14 | PD12 | PD10 | PB14 | PB12 | PB10 | PD8 | PE10 | PE12 | PC8 | PC6 | PE14 | PA8 | PE8 | PB1 | PC5 | PA7 | PA5 | PA3 | 陀螺仪
